# Altium schematic sheet Sheet_BDD.SchDoc (part 1 of 2)
size A3; SheetNumber: 1; SheetTotal: 1
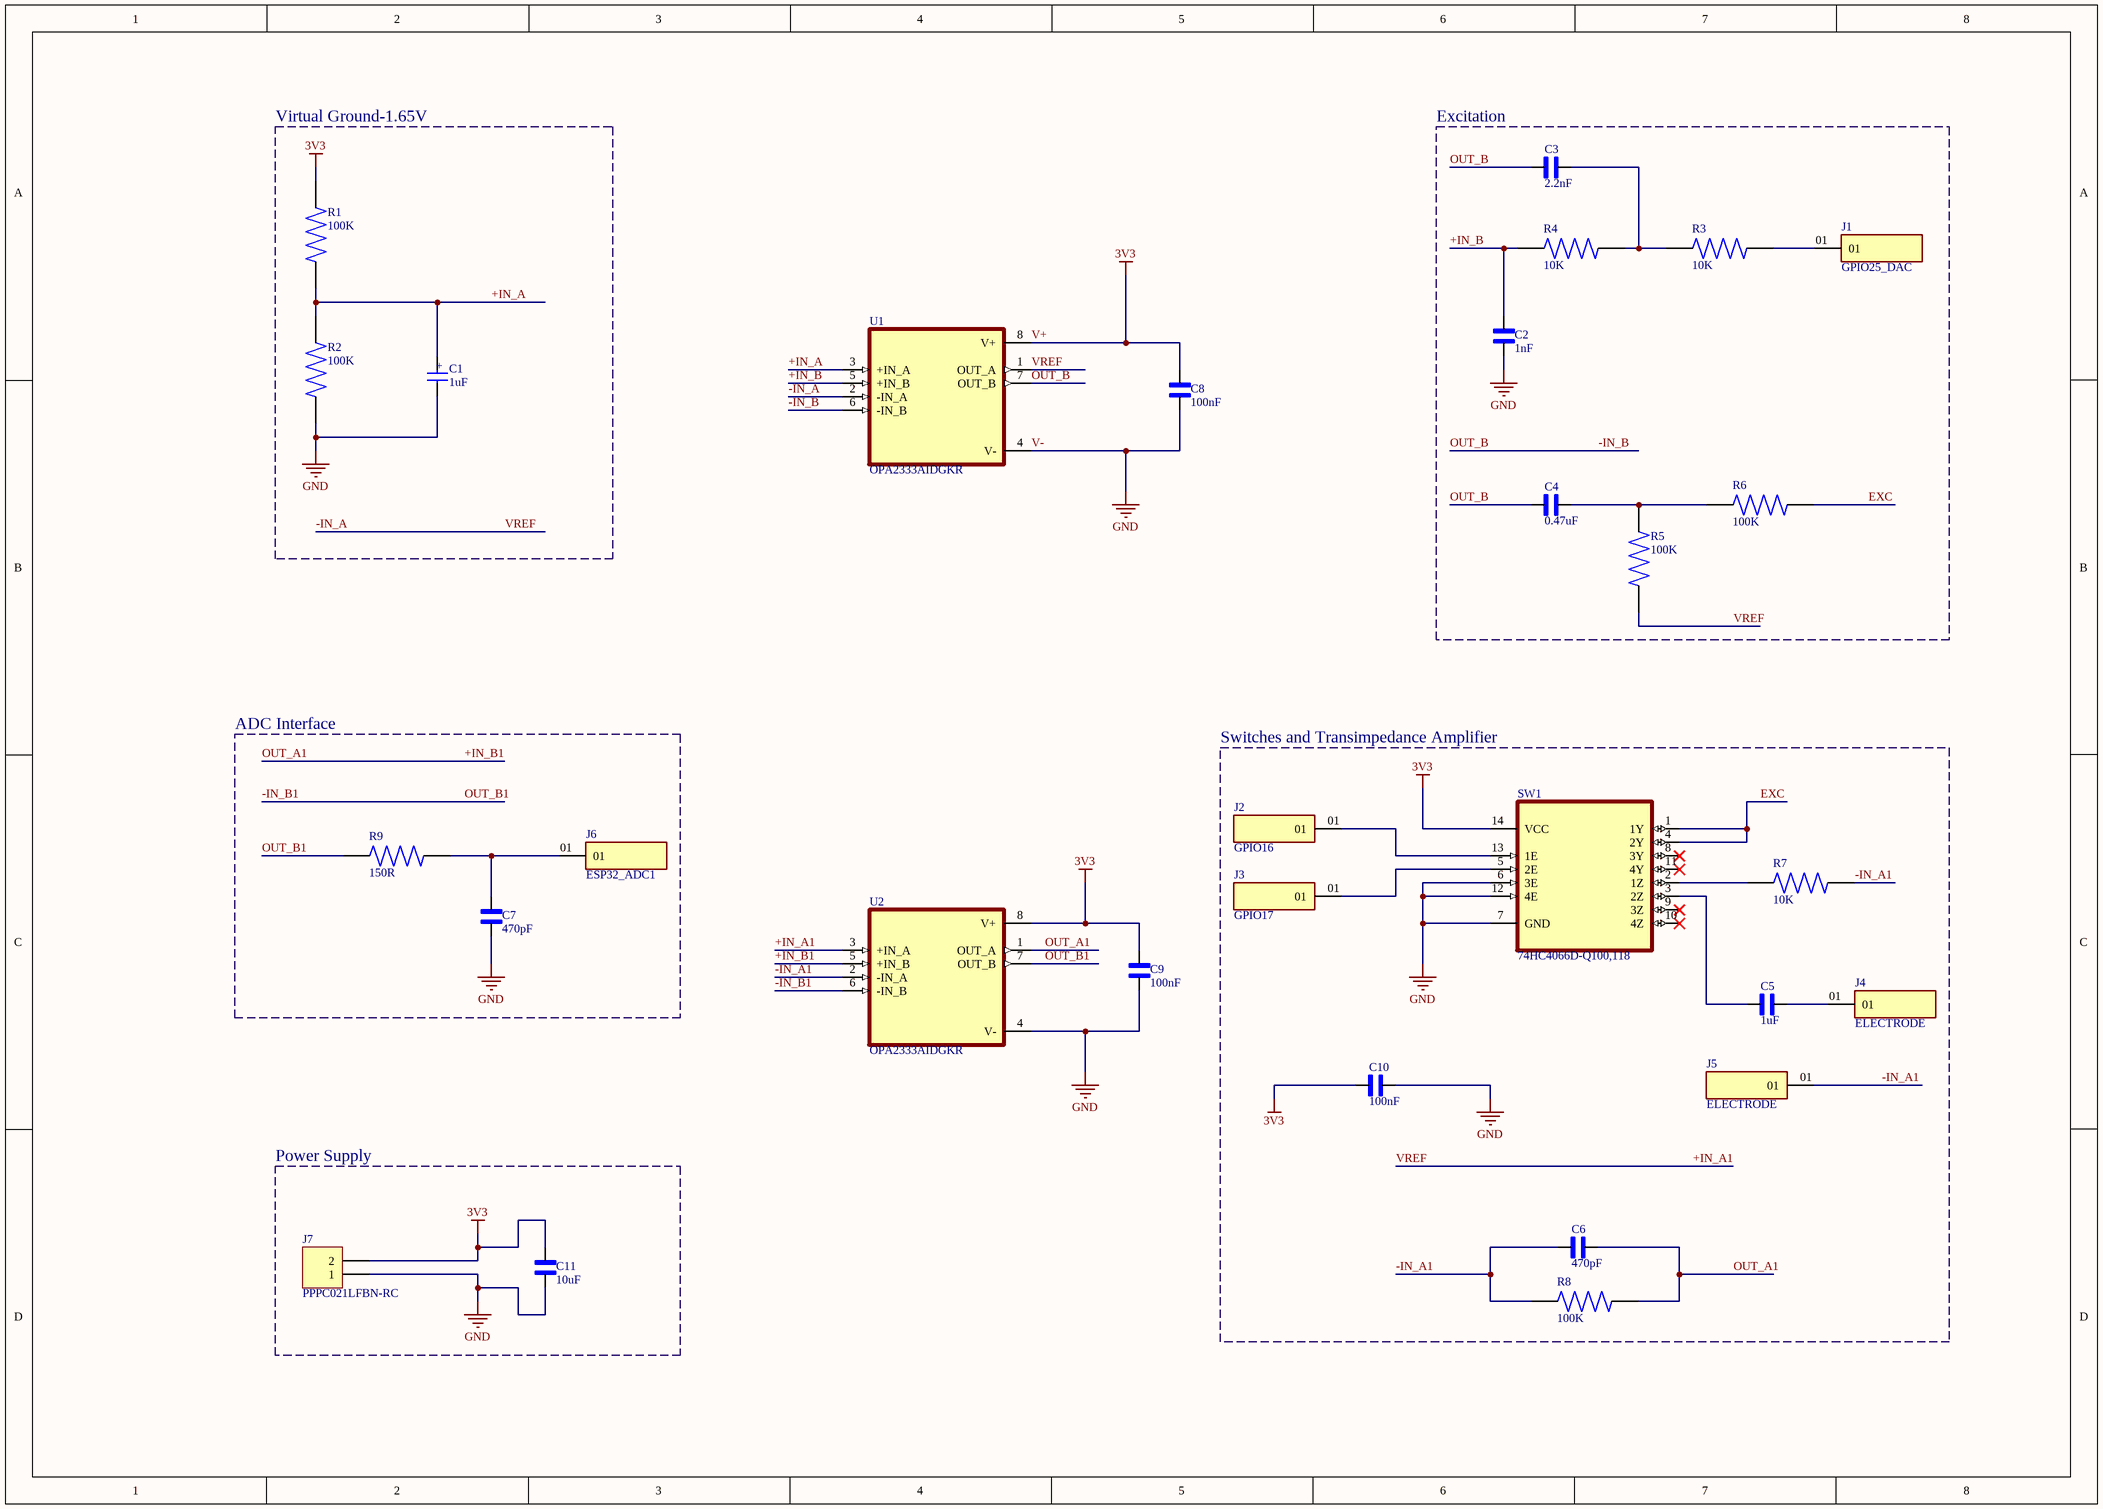
[diagram p0: Sheet_BDD.SchDoc]

## Parts
C1  1uF  [WCAP-ATG5_5X11(DXL)]
C2  1nF  [CAPC2012X140N]
C3  2.2nF  [CAPC2012X88N]
C4  0.47uF  [CAPC2012X140N]
C5  1uF  [CAPC2012X140N]
C6  470pF  [CAPC2012X88N]
C7  470pF  [CAPC2012X88N]
C8  100nF  [CAPC2012X140N]
C9  100nF  [CAPC2012X140N]
C10  100nF  [CAPC2012X140N]
C11  10uF  [CAPC2012X140N]
J1  GPIO25_DAC  [SAMTEC_SLW-101-01-T-S]
J2  GPIO16  [SAMTEC_SLW-101-01-T-S]
J3  GPIO17  [SAMTEC_SLW-101-01-T-S]
J4  ELECTRODE  [SAMTEC_SLW-101-01-T-S]
J5  ELECTRODE  [SAMTEC_SLW-101-01-T-S]
J6  ESP32_ADC1  [SAMTEC_SLW-101-01-T-S]
J7  PPPC021LFBN-RC  [My_1X02]
R1  100K  [RESC2012X65N]
R2  100K  [RESC2012X65N]
R3  10K  [RESC2012X65N]
R4  10K  [RESC2012X65N]
R5  100K  [RESC2012X65N]
R6  100K  [RESC2012X65N]
R7  10K  [RESC2012X65N]
R8  100K  [RESC2012X65N]
R9  150R  [RESC2012X65N]
SW1  74HC4066D-Q100,118  [SOIC127P600X175-14N]
U1  OPA2333AIDGKR  [SOP65P490X110-8N]
U2  OPA2333AIDGKR  [SOP65P490X110-8N]

## Blocks framed on the sheet
Virtual Ground-1.65V: C1 R1 R2
Excitation: C2-C4 J1 R3-R6
ADC Interface: C7 J6 R9
Switches and Transimpedance Amplifier: C5 C6 C10 J2-J5 R7 R8 SW1
Power Supply: C11 J7

## Nets
V+: C8.2 C9.2 C10.1 C11.2 J7.2 R1.2 SW1.14(VCC) U1.8(V+) U2.8(V+)  [also labelled 3V3]
V-: C1.2(NEG) C2.1 C7.1 C8.1 C9.1 C10.2 C11.1 J7.1 R2.1 SW1.6(3E) SW1.7(GND) SW1.12(4E) U1.4(V-) U2.4(V-)  [also labelled GND]
+IN_A: C1.1(POS) R1.1 R2.2 U1.3(+IN_A)
+IN_A1: R5.1 U1.1(OUT_A) U1.2(-IN_A) U2.3(+IN_A)  [also labelled -IN_A, VREF]
+IN_B: C2.2 R4.1 U1.5(+IN_B)
+IN_B1: C6.2 R8.2 U2.1(OUT_A) U2.5(+IN_B)  [also labelled OUT_A1]
-IN_A1: C6.1 J5.01 R7.2 R8.1 U2.2(-IN_A)
-IN_B: C3.1 C4.1 U1.6(-IN_B) U1.7(OUT_B)  [also labelled OUT_B]
-IN_B1: R9.1 U2.6(-IN_B) U2.7(OUT_B)  [also labelled OUT_B1]
EXC: R6.1 SW1.1(1Y) SW1.4(2Y)
NetC3_2: C3.2 R3.1 R4.2
NetC4_2: C4.2 R5.2 R6.2
NetC5_1: C5.1 SW1.3(2Z)
NetC5_2: C5.2 J4.01
NetC7_2: C7.2 J6.01 R9.2
NetJ1_01: J1.01 R3.2
NetJ2_01: J2.01 SW1.13(1E)
NetJ3_01: J3.01 SW1.5(2E)
NetR7_1: R7.1 SW1.2(1Z)

Not connected (* = marked no-connect by the designer): SW1 8(3Y)* 9(3Z)* 10(4Z)* 11(4Y)*
## Library data of the parts
C1 = 860020672005: CAP ALUM 1UF 20% 50V RADIAL TH; Manufacturer: Wurth Elektronik; Manufacturer Lifecycle Status: ACTIVE; Value: 1µF; ESR (Equivalent Series Resistance): 39.553Ω; Hole Diameter: 800µm; Leakage Current: 3µA; Life (Hours): 2000hours; Pitch: 2mm; Polarity: Polar; Ripple Current: 13mA; YEOL: 1 = Estimated lifetime > 10 years; Supplier: DigiKey; Supplier Part Number: 732-8851-3-ND; Manufacturer Part Number: 860020672005; RoHS: Compliant; Category: Aluminum Electrolytic Capacitors; Stock: 70000; Pricing: 2000=0.0551 (USD); Case/Package: Radial; Diameter: 5mm; Height: 11mm; Height - Seated (Max): 12.4968mm; Lead Pitch: 2.0066mm; Length: 11mm; Lifecycle Status: Production; Max Operating Temperature: 105°C; Min Operating Temperature: -40°C; Mounting Technology: Through Hole; Packaging: Tape & Box (TB); REACH SVHC: Unknown; Tolerance: 20%; Voltage Rating: 50V; Voltage Rating (DC): 50V; ComponentLink1URL: https://datasheet.octopart.com:443/860020672005-Wurth-Elektronik-datasheet-159617218.pdf?src-supplier=Wurth+Elektronik; ComponentLink1Description: https://datasheet.octopart.com:443/860020672005-Wurth-Elektronik-datasheet-159617218.pdf?src-supplier=Wurth+Elektronik; ComponentLink2URL: https://datasheet.octopart.com:443/860020672005-W%C3%BCrth-Elektronik-datasheet-37143900.pdf?src-supplier=RS+(Formerly+Allied+Electronics); ComponentLink2Description: https://datasheet.octopart.com:443/860020672005-W%C3%BCrth-Elektronik-datasheet-37143900.pdf?src-supplier=RS+(Formerly+Allied+Electronics)
C2 = C0805C102K5RACTU: CAP CER 1000PF 50V X7R 0805; Manufacturer: Yageo Group; Dielectric Material: Ceramic; Temperature Coefficient: 30ppm/°C; Tolerance: 10%; Supplier: DigiKey; Supplier Part Number: 399-C0805C102K5RACTUCT-ND; Manufacturer Part Number: C0805C102K5RACTU; RoHS: Compliant; Category: Ceramic Capacitors; Stock: 586001; Pricing: 1=0.16, 10=0.088, 50=0.0612, 100=0.0529, 500=0.03924 (USD); Value: 1nF; Case/Package: 0805; Case Code (Imperial): 0805; China RoHS: Compliant; Contact Plating: Tin; Country of Origin: Mexico; Depth: 1.25mm; Dielectric: X7R; Export Control Classification Number (ECCN) Code: EAR99; Height: 780µm; Harmonized Tariff Schedule (HTS) Code: 8532.24.00.20; Introduction Date: 2008-01-10; Lead Free: Lead Free; Lead Pitch: 750µm; Length: 2mm; Lifecycle Status: Production; Material: Ceramic; Max Operating Temperature: 125°C; Min Operating Temperature: -55°C; Mounting Technology: Surface Mount; Pins: 2; Number of Terminals: 2; Packaging: Cut Tape; Radiation Hardening: No; REACH SVHC: Unaffected; Schedule B: 8532240020, 8532240020|8532240020, 8532240020|8532240020|8532240020, 8532240020|8532240020|8532240020|8532240020; Termination: SMD/SMT; Thickness: 889µm; Voltage: 50V; Voltage Rating: 50V; Voltage Rating (DC): 50V; Width: 1.25mm; ComponentLink1URL: https://datasheet.octopart.com:443/C0805C102K5RAC7800-KEMET-datasheet-179100141.pdf?src-supplier=IHS; ComponentLink1Description: https://datasheet.octopart.com:443/C0805C102K5RAC7800-KEMET-datasheet-179100141.pdf?src-supplier=IHS; ComponentLink2URL: https://datasheet.octopart.com:443/C0805C102K5RACTU-KEMET-datasheet-178445679.pdf?src-supplier=IHS; ComponentLink2Description: https://datasheet.octopart.com:443/C0805C102K5RACTU-KEMET-datasheet-178445679.pdf?src-supplier=IHS; ComponentLink3URL: https://datasheet.octopart.com:443/C0805C102K5RACTU-KEMET-datasheet-137357759.pdf?src-supplier=Farnell; ComponentLink3Description: https://datasheet.octopart.com:443/C0805C102K5RACTU-KEMET-datasheet-137357759.pdf?src-supplier=Farnell; ComponentLink4URL: https://datasheet.octopart.com:443/C0805C102K5RACTU-KEMET-datasheet-32036385.pdf?src-supplier=Farnell; ComponentLink4Description: https://datasheet.octopart.com:443/C0805C102K5RACTU-KEMET-datasheet-32036385.pdf?src-supplier=Farnell; ComponentLink5URL: https://datasheet.octopart.com:443/C0805C102K5RACTU-Kemet-datasheet-12608295.pdf?src-supplier=Farnell; ComponentLink5Description: https://datasheet.octopart.com:443/C0805C102K5RACTU-Kemet-datasheet-12608295.pdf?src-supplier=Farnell; ComponentLink6URL: https://datasheet.octopart.com:443/C0805C102K5RACTU-Kemet-datasheet-11992184.pdf?src-supplier=Farnell; ComponentLink6Description: https://datasheet.octopart.com:443/C0805C102K5RACTU-Kemet-datasheet-11992184.pdf?src-supplier=Farnell; ComponentLink7URL: https://datasheet.octopart.com:443/C0805C102K5RACTU-Kemet-datasheet-10942409.pdf?src-supplier=Farnell; ComponentLink7Description: https://datasheet.octopart.com:443/C0805C102K5RACTU-Kemet-datasheet-10942409.pdf?src-supplier=Farnell; ComponentLink8URL: https://datasheet.octopart.com:443/C0805C102K5RACTU-Kemet-datasheet-10404442.pdf?src-supplier=Farnell; ComponentLink8Description: https://datasheet.octopart.com:443/C0805C102K5RACTU-Kemet-datasheet-10404442.pdf?src-supplier=Farnell; ComponentLink9URL: https://datasheet.octopart.com:443/C0805C102K5RACTU-KEMET-datasheet-101576065.pdf?src-supplier=Farnell; ComponentLink9Description: https://datasheet.octopart.com:443/C0805C102K5RACTU-KEMET-datasheet-101576065.pdf?src-supplier=Farnell; ComponentLink10URL: https://datasheet.octopart.com:443/C0805C102K5RACTU.-Kemet-datasheet-41232427.pdf?src-supplier=Farnell; ComponentLink10Description: https://datasheet.octopart.com:443/C0805C102K5RACTU.-Kemet-datasheet-41232427.pdf?src-supplier=Farnell; ComponentLink11URL: https://datasheet.octopart.com:443/C0805C102K5RACTU-KEMET-datasheet-176142286.pdf?src-supplier=Farnell; ComponentLink11Description: https://datasheet.octopart.com:443/C0805C102K5RACTU-KEMET-datasheet-176142286.pdf?src-supplier=Farnell; ComponentLink12URL: https://datasheet.octopart.com:443/C0805C102K5RAC-TU-Kemet-datasheet-7833651.pdf?src-supplier=Farnell; ComponentLink12Description: https://datasheet.octopart.com:443/C0805C102K5RAC-TU-Kemet-datasheet-7833651.pdf?src-supplier=Farnell; ComponentLink13URL: https://datasheet.octopart.com:443/C0805C102K5RAC-TU-Kemet-datasheet-7601896.pdf?src-supplier=Farnell; ComponentLink13Description: https://datasheet.octopart.com:443/C0805C102K5RAC-TU-Kemet-datasheet-7601896.pdf?src-supplier=Farnell; ComponentLink14URL: https://datasheet.octopart.com:443/C0805C102K5RAC-TU-Kemet-datasheet-5316294.pdf?src-supplier=Farnell; ComponentLink14Description: https://datasheet.octopart.com:443/C0805C102K5RAC-TU-Kemet-datasheet-5316294.pdf?src-supplier=Farnell; ComponentLink15URL: https://datasheet.octopart.com:443/C0805C102K5RAC-TU-Kemet-datasheet-5314837.pdf?src-supplier=Farnell; ComponentLink15Description: https://datasheet.octopart.com:443/C0805C102K5RAC-TU-Kemet-datasheet-5314837.pdf?src-supplier=Farnell; ComponentLink16URL: https://datasheet.octopart.com:443/C0805C102K5RAC-TU-Kemet-datasheet-8092359.pdf?src-supplier=Farnell; ComponentLink16Description: https://datasheet.octopart.com:443/C0805C102K5RAC-TU-Kemet-datasheet-8092359.pdf?src-supplier=Farnell; ComponentLink17URL: https://datasheet.octopart.com:443/C0805C102K5RACTU-Kemet-datasheet-5314449.pdf?src-supplier=Farnell; ComponentLink17Description: https://datasheet.octopart.com:443/C0805C102K5RACTU-Kemet-datasheet-5314449.pdf?src-supplier=Farnell; ComponentLink18URL: https://datasheet.octopart.com:443/C0805C102K5RAC-TU-Kemet-datasheet-5314969.pdf?src-supplier=Farnell; ComponentLink18Description: https://datasheet.octopart.com:443/C0805C102K5RAC-TU-Kemet-datasheet-5314969.pdf?src-supplier=Farnell; ComponentLink19URL: https://datasheet.octopart.com:443/C0805C102K5RAC-TU-Kemet-datasheet-5314627.pdf?src-supplier=Farnell; ComponentLink19Description: https://datasheet.octopart.com:443/C0805C102K5RAC-TU-Kemet-datasheet-5314627.pdf?src-supplier=Farnell; ComponentLink20URL: https://datasheet.octopart.com:443/C0805C102K5RAC-TU-Kemet-datasheet-5389132.pdf?src-supplier=Farnell; ComponentLink20Description: https://datasheet.octopart.com:443/C0805C102K5RAC-TU-Kemet-datasheet-5389132.pdf?src-supplier=Farnell; ComponentLink21URL: https://datasheet.octopart.com:443/C0805C102K5RAC-TU-Kemet-datasheet-5313836.pdf?src-supplier=Farnell; ComponentLink21Description: https://datasheet.octopart.com:443/C0805C102K5RAC-TU-Kemet-datasheet-5313836.pdf?src-supplier=Farnell; ComponentLink22URL: https://datasheet.octopart.com:443/C0805C102K5RAC-TU-Kemet-datasheet-8111010.pdf?src-supplier=Farnell; ComponentLink22Description: https://datasheet.octopart.com:443/C0805C102K5RAC-TU-Kemet-datasheet-8111010.pdf?src-supplier=Farnell; ComponentLink23URL: https://datasheet.octopart.com:443/C0805C102K5RAC-TU-Kemet-datasheet-7627733.pdf?src-supplier=Farnell; ComponentLink23Description: https://datasheet.octopart.com:443/C0805C102K5RAC-TU-Kemet-datasheet-7627733.pdf?src-supplier=Farnell; ComponentLink24URL: https://datasheet.octopart.com:443/C0805C102K5RAC-TU-Kemet-datasheet-5315946.pdf?src-supplier=Farnell; ComponentLink24Description: https://datasheet.octopart.com:443/C0805C102K5RAC-TU-Kemet-datasheet-5315946.pdf?src-supplier=Farnell; ComponentLink25URL: https://datasheet.octopart.com:443/C0805C102K5RACTU-KEMET-datasheet-68331921.pdf?src-supplier=Upverter; ComponentLink25Description: https://datasheet.octopart.com:443/C0805C102K5RACTU-KEMET-datasheet-68331921.pdf?src-supplier=Upverter; ComponentLink26URL: https://datasheet.octopart.com:443/C0805C102K5RAC-TU-Kemet-datasheet-5313890.pdf?src-supplier=Newark; ComponentLink26Description: https://datasheet.octopart.com:443/C0805C102K5RAC-TU-Kemet-datasheet-5313890.pdf?src-supplier=Newark; ComponentLink27URL: https://datasheet.octopart.com:443/C0805C102K5RACTU-KEMET-datasheet-130256537.pdf?src-supplier=Newark; ComponentLink27Description: https://datasheet.octopart.com:443/C0805C102K5RACTU-KEMET-datasheet-130256537.pdf?src-supplier=Newark; ComponentLink28URL: https://datasheet.octopart.com:443/C0805C102K5RAC-TU-Kemet-datasheet-5390537.pdf?src-supplier=Newark; ComponentLink28Description: https://datasheet.octopart.com:443/C0805C102K5RAC-TU-Kemet-datasheet-5390537.pdf?src-supplier=Newark; ComponentLink29URL: https://datasheet.octopart.com:443/C0805C102K5RAC-TU-Kemet-datasheet-7541751.pdf?src-supplier=Newark; ComponentLink29Description: https://datasheet.octopart.com:443/C0805C102K5RAC-TU-Kemet-datasheet-7541751.pdf?src-supplier=Newark; ComponentLink30URL: https://datasheet.octopart.com:443/C0805C102K5RACTU-KEMET-datasheet-176289583.pdf?src-supplier=Newark; ComponentLink30Description: https://datasheet.octopart.com:443/C0805C102K5RACTU-KEMET-datasheet-176289583.pdf?src-supplier=Newark; ComponentLink31URL: https://datasheet.octopart.com:443/C0805C102K5RACTU-Kemet-datasheet-8764837.pdf?src-supplier=Newark; ComponentLink31Description: https://datasheet.octopart.com:443/C0805C102K5RACTU-Kemet-datasheet-8764837.pdf?src-supplier=Newark; ComponentLink32URL: https://datasheet.octopart.com:443/C0805C102K5RACTU-Kemet-datasheet-8480123.pdf?src-supplier=Newark; ComponentLink32Description: https://datasheet.octopart.com:443/C0805C102K5RACTU-Kemet-datasheet-8480123.pdf?src-supplier=Newark; ComponentLink33URL: https://datasheet.octopart.com:443/C0805C102K5RACTU-Kemet-datasheet-5393970.pdf?src-supplier=Newark; ComponentLink33Description: https://datasheet.octopart.com:443/C0805C102K5RACTU-Kemet-datasheet-5393970.pdf?src-supplier=Newark; ComponentLink34URL: https://datasheet.octopart.com:443/C0805C102K5RACTU-Kemet-datasheet-8502025.pdf?src-supplier=Newark; ComponentLink34Description: https://datasheet.octopart.com:443/C0805C102K5RACTU-Kemet-datasheet-8502025.pdf?src-supplier=Newark; ComponentLink35URL: https://datasheet.octopart.com:443/C0805C102K5RACTU-Kemet-datasheet-161801.pdf?src-supplier=Newark; ComponentLink35Description: https://datasheet.octopart.com:443/C0805C102K5RACTU-Kemet-datasheet-161801.pdf?src-supplier=Newark; ComponentLink36URL: https://datasheet.octopart.com:443/C0805C102K5RACTU-KEMET-datasheet-184787613.pdf?src-supplier=Newark; ComponentLink36Description: https://datasheet.octopart.com:443/C0805C102K5RACTU-KEMET-datasheet-184787613.pdf?src-supplier=Newark; ComponentLink37URL: https://datasheet.octopart.com:443/C0805C102K5RAC7800-KEMET-datasheet-37550250.pdf?src-supplier=Electro+Sonic; ComponentLink37Description: https://datasheet.octopart.com:443/C0805C102K5RAC7800-KEMET-datasheet-37550250.pdf?src-supplier=Electro+Sonic; ComponentLink38URL: https://datasheet.octopart.com:443/C0805C102K5RAC7800-KEMET-datasheet-188512054.pdf?src-supplier=ODG+(Origin+Data+Global); ComponentLink38Description: https://datasheet.octopart.com:443/C0805C102K5RAC7800-KEMET-datasheet-188512054.pdf?src-supplier=ODG+(Origin+Data+Global); ComponentLink39URL: https://datasheet.octopart.com:443/C0805C102K5RACTU-KEMET-datasheet-164512540.pdf?src-supplier=TME; ComponentLink39Description: https://datasheet.octopart.com:443/C0805C102K5RACTU-KEMET-datasheet-164512540.pdf?src-supplier=TME; ComponentLink40URL: https://datasheet.octopart.com:443/C0805C102K5RACTU-Kemet-datasheet-67847102.pdf?src-supplier=TME; ComponentLink40Description: https://datasheet.octopart.com:443/C0805C102K5RACTU-Kemet-datasheet-67847102.pdf?src-supplier=TME; ComponentLink41URL: https://datasheet.octopart.com:443/C0805C102K5RACTU-KEMET-datasheet-68331906.pdf?src-supplier=TME; ComponentLink41Description: https://datasheet.octopart.com:443/C0805C102K5RACTU-KEMET-datasheet-68331906.pdf?src-supplier=TME; ComponentLink42URL: https://datasheet.octopart.com:443/C0805C102K5RACTU-KEMET-datasheet-110724412.pdf?src-supplier=RS+(Formerly+Allied+Electronics); ComponentLink42Description: https://datasheet.octopart.com:443/C0805C102K5RACTU-KEMET-datasheet-110724412.pdf?src-supplier=RS+(Formerly+Allied+Electronics); ComponentLink43URL: https://datasheet.octopart.com:443/C0805C102K5RACTU-Kemet-datasheet-464.pdf?src-supplier=RS+(Formerly+Allied+Electronics); ComponentLink43Description: https://datasheet.octopart.com:443/C0805C102K5RACTU-Kemet-datasheet-464.pdf?src-supplier=RS+(Formerly+Allied+Electronics); ComponentLink44URL: https://datasheet.octopart.com/C0805C102K5RACTU-KEMET-datasheet-84169754.pdf; ComponentLink44Description: https://datasheet.octopart.com/C0805C102K5RACTU-KEMET-datasheet-84169754.pdf; ComponentLink45URL: https://datasheet.octopart.com:443/C0805C102K5RACTU-Kemet-datasheet-24570007.pdf?src-supplier=element14+APAC; ComponentLink45Description: https://datasheet.octopart.com:443/C0805C102K5RACTU-Kemet-datasheet-24570007.pdf?src-supplier=element14+APAC; ComponentLink46URL: https://datasheet.octopart.com:443/C0805C102K5RACTU-Kemet-datasheet-22084244.pdf?src-supplier=element14+APAC; ComponentLink46Description: https://datasheet.octopart.com:443/C0805C102K5RACTU-Kemet-datasheet-22084244.pdf?src-supplier=element14+APAC; ComponentLink47URL: https://datasheet.octopart.com:443/C0805C102K5RACTU-Kemet-datasheet-11791272.pdf?src-supplier=Arrow+Electronics; ComponentLink47Description: https://datasheet.octopart.com:443/C0805C102K5RACTU-Kemet-datasheet-11791272.pdf?src-supplier=Arrow+Electronics; ComponentLink48URL: https://datasheet.octopart.com:443/C0805C102K5RAC7800-Kemet-datasheet-11546808.pdf?src-supplier=Arrow+Electronics; ComponentLink48Description: https://datasheet.octopart.com:443/C0805C102K5RAC7800-Kemet-datasheet-11546808.pdf?src-supplier=Arrow+Electronics; ComponentLink49URL: https://datasheet.octopart.com:443/C0805C102K5RAC7800-KEMET-datasheet-164857143.pdf?src-supplier=Burklin+Elektronik; ComponentLink49Description: https://datasheet.octopart.com:443/C0805C102K5RAC7800-KEMET-datasheet-164857143.pdf?src-supplier=Burklin+Elektronik; ComponentLink50URL: https://datasheet.octopart.com:443/C0805C102K5RAC-TU-Kemet-datasheet-7272872.pdf?src-supplier=Jameco+(USA); ComponentLink50Description: https://datasheet.octopart.com:443/C0805C102K5RAC-TU-Kemet-datasheet-7272872.pdf?src-supplier=Jameco+(USA); ComponentLink51URL: http://sigma.octopart.com:80/conflict_mineral_statement/Yageo-company-3.pdf?src-supplier=Compliance+Statements; ComponentLink51Description: http://sigma.octopart.com:80/conflict_mineral_statement/Yageo-company-3.pdf?src-supplier=Compliance+Statements; ComponentLink52URL: http://sigma.octopart.com:80/rohs_statement/Yageo-company-2.pdf?src-supplier=Compliance+Statements; ComponentLink52Description: http://sigma.octopart.com:80/rohs_statement/Yageo-company-2.pdf?src-supplier=Compliance+Statements
C3 = C0805C222K5RACTU: CAP CER 2200PF 50V X7R 0805; Manufacturer: Yageo Group; Manufacturer Package Identifier: 0805 (2012 metric); Dielectric Material: Ceramic; Dissipation Factor: 2.5%; Temperature Coefficient: 30ppm/°C; Tolerance: 10%; Supplier: DigiKey; Supplier Part Number: 399-C0805C222K5RACTUCT-ND; Manufacturer Part Number: C0805C222K5RACTU; RoHS: Compliant; Category: Ceramic Capacitors; Stock: 238598; Pricing: 1=0.1, 10=0.055, 50=0.037, 100=0.0318, 500=0.02296 (USD); Value: 2.2nF; Case/Package: 0805; Case Code (Imperial): 0805; China RoHS: Compliant; Country of Origin: Mexico; Depth: 1.25mm; Dielectric: X7R; Export Control Classification Number (ECCN) Code: EAR99; Height: 780µm; Harmonized Tariff Schedule (HTS) Code: 8532.24.00.20; Introduction Date: 2008-01-10; Lead Free: Lead Free; Lead Pitch: 750µm; Length: 2mm; Lifecycle Status: Production; Material: Ceramic; Max Operating Temperature: 125°C; Min Operating Temperature: -55°C; Mounting Technology: Surface Mount; Pins: 2; Number of Terminals: 2; Packaging: Cut Tape; Radiation Hardening: No; REACH SVHC: Unaffected; Schedule B: 8532240020, 8532240020|8532240020, 8532240020|8532240020|8532240020, 8532240020|8532240020|8532240020|8532240020; Termination: SMD/SMT; Thickness: 889µm; Voltage: 50V; Voltage Rating: 50V; Voltage Rating (AC): 50V; Voltage Rating (DC): 50V; Width: 1.25mm; ComponentLink1URL: https://datasheet.octopart.com:443/C0805C222K5RACTU-KEMET-datasheet-178445679.pdf?src-supplier=Farnell; ComponentLink1Description: https://datasheet.octopart.com:443/C0805C222K5RACTU-KEMET-datasheet-178445679.pdf?src-supplier=Farnell; ComponentLink2URL: https://datasheet.octopart.com:443/C0805C222K5RACTU-KEMET-datasheet-137357759.pdf?src-supplier=Farnell; ComponentLink2Description: https://datasheet.octopart.com:443/C0805C222K5RACTU-KEMET-datasheet-137357759.pdf?src-supplier=Farnell; ComponentLink3URL: https://datasheet.octopart.com:443/C0805C222K5RACTU-Kemet-datasheet-5313890.pdf?src-supplier=Farnell; ComponentLink3Description: https://datasheet.octopart.com:443/C0805C222K5RACTU-Kemet-datasheet-5313890.pdf?src-supplier=Farnell; ComponentLink4URL: https://datasheet.octopart.com:443/C0805C222K5RACTU-Kemet-datasheet-8764837.pdf?src-supplier=Farnell; ComponentLink4Description: https://datasheet.octopart.com:443/C0805C222K5RACTU-Kemet-datasheet-8764837.pdf?src-supplier=Farnell; ComponentLink5URL: https://datasheet.octopart.com:443/C0805C222K5RACTU-Kemet-datasheet-8480123.pdf?src-supplier=Farnell; ComponentLink5Description: https://datasheet.octopart.com:443/C0805C222K5RACTU-Kemet-datasheet-8480123.pdf?src-supplier=Farnell; ComponentLink6URL: https://datasheet.octopart.com:443/C0805C222K5RACTU-Kemet-datasheet-5390537.pdf?src-supplier=Farnell; ComponentLink6Description: https://datasheet.octopart.com:443/C0805C222K5RACTU-Kemet-datasheet-5390537.pdf?src-supplier=Farnell; ComponentLink7URL: https://datasheet.octopart.com:443/C0805C222K5RACTU-Kemet-datasheet-5393970.pdf?src-supplier=Farnell; ComponentLink7Description: https://datasheet.octopart.com:443/C0805C222K5RACTU-Kemet-datasheet-5393970.pdf?src-supplier=Farnell; ComponentLink8URL: https://datasheet.octopart.com:443/C0805C222K5RACTU-Kemet-datasheet-8502025.pdf?src-supplier=Farnell; ComponentLink8Description: https://datasheet.octopart.com:443/C0805C222K5RACTU-Kemet-datasheet-8502025.pdf?src-supplier=Farnell; ComponentLink9URL: https://datasheet.octopart.com:443/C0805C222K5RACTU-Kemet-datasheet-7541751.pdf?src-supplier=Farnell; ComponentLink9Description: https://datasheet.octopart.com:443/C0805C222K5RACTU-Kemet-datasheet-7541751.pdf?src-supplier=Farnell; ComponentLink10URL: https://datasheet.octopart.com:443/C0805C222K5RACTU-Kemet-datasheet-161801.pdf?src-supplier=Farnell; ComponentLink10Description: https://datasheet.octopart.com:443/C0805C222K5RACTU-Kemet-datasheet-161801.pdf?src-supplier=Farnell; ComponentLink11URL: https://datasheet.octopart.com:443/C0805C222K5RACTU-KEMET-datasheet-101576227.pdf?src-supplier=Farnell; ComponentLink11Description: https://datasheet.octopart.com:443/C0805C222K5RACTU-KEMET-datasheet-101576227.pdf?src-supplier=Farnell; ComponentLink12URL: https://datasheet.octopart.com:443/C0805C222K5RACTU.-Kemet-datasheet-41232427.pdf?src-supplier=Farnell; ComponentLink12Description: https://datasheet.octopart.com:443/C0805C222K5RACTU.-Kemet-datasheet-41232427.pdf?src-supplier=Farnell; ComponentLink13URL: https://datasheet.octopart.com:443/C0805C222K5RACTU-KEMET-datasheet-176142323.pdf?src-supplier=Farnell; ComponentLink13Description: https://datasheet.octopart.com:443/C0805C222K5RACTU-KEMET-datasheet-176142323.pdf?src-supplier=Farnell; ComponentLink14URL: https://datasheet.octopart.com:443/C0805C222K5RACTU-Kemet-datasheet-12608295.pdf?src-supplier=Farnell; ComponentLink14Description: https://datasheet.octopart.com:443/C0805C222K5RACTU-Kemet-datasheet-12608295.pdf?src-supplier=Farnell; ComponentLink15URL: https://datasheet.octopart.com:443/C0805C222K5RACTU-Kemet-datasheet-11992184.pdf?src-supplier=Farnell; ComponentLink15Description: https://datasheet.octopart.com:443/C0805C222K5RACTU-Kemet-datasheet-11992184.pdf?src-supplier=Farnell; ComponentLink16URL: https://datasheet.octopart.com:443/C0805C222K5RACTU-Kemet-datasheet-10942409.pdf?src-supplier=Farnell; ComponentLink16Description: https://datasheet.octopart.com:443/C0805C222K5RACTU-Kemet-datasheet-10942409.pdf?src-supplier=Farnell; ComponentLink17URL: https://datasheet.octopart.com:443/C0805C222K5RACTU-Kemet-datasheet-10404442.pdf?src-supplier=Farnell; ComponentLink17Description: https://datasheet.octopart.com:443/C0805C222K5RACTU-Kemet-datasheet-10404442.pdf?src-supplier=Farnell; ComponentLink18URL: https://datasheet.octopart.com:443/C0805C222K5RACTU-Kemet-datasheet-500041.pdf?src-supplier=Farnell; ComponentLink18Description: https://datasheet.octopart.com:443/C0805C222K5RACTU-Kemet-datasheet-500041.pdf?src-supplier=Farnell; ComponentLink19URL: https://datasheet.octopart.com:443/C0805C222K5RACTU-KEMET-datasheet-182041860.pdf?src-supplier=IHS; ComponentLink19Description: https://datasheet.octopart.com:443/C0805C222K5RACTU-KEMET-datasheet-182041860.pdf?src-supplier=IHS; ComponentLink20URL: https://datasheet.octopart.com:443/C0805C222K5RACTU-KEMET-datasheet-68331921.pdf?src-supplier=Upverter; ComponentLink20Description: https://datasheet.octopart.com:443/C0805C222K5RACTU-KEMET-datasheet-68331921.pdf?src-supplier=Upverter; ComponentLink21URL: https://datasheet.octopart.com:443/C0805C222K5RACTU-KEMET-datasheet-130256537.pdf?src-supplier=Newark; ComponentLink21Description: https://datasheet.octopart.com:443/C0805C222K5RACTU-KEMET-datasheet-130256537.pdf?src-supplier=Newark; ComponentLink22URL: https://datasheet.octopart.com:443/C0805C222K5RACTU-KEMET-datasheet-170667462.pdf?src-supplier=Newark; ComponentLink22Description: https://datasheet.octopart.com:443/C0805C222K5RACTU-KEMET-datasheet-170667462.pdf?src-supplier=Newark; ComponentLink23URL: https://datasheet.octopart.com:443/C0805C222K5RACTU-Kemet-datasheet-27203261.pdf?src-supplier=Newark; ComponentLink23Description: https://datasheet.octopart.com:443/C0805C222K5RACTU-Kemet-datasheet-27203261.pdf?src-supplier=Newark; ComponentLink24URL: https://datasheet.octopart.com:443/C0805C222K5RACTU-KEMET-datasheet-37550250.pdf?src-supplier=Electro+Sonic; ComponentLink24Description: https://datasheet.octopart.com:443/C0805C222K5RACTU-KEMET-datasheet-37550250.pdf?src-supplier=Electro+Sonic; ComponentLink25URL: https://datasheet.octopart.com:443/C0805C222K5RACTU-KEMET-datasheet-178249621.pdf?src-supplier=Master+Electronics; ComponentLink25Description: https://datasheet.octopart.com:443/C0805C222K5RACTU-KEMET-datasheet-178249621.pdf?src-supplier=Master+Electronics; ComponentLink26URL: https://datasheet.octopart.com:443/C0805C222K5RACTU-KEMET-datasheet-164512540.pdf?src-supplier=TME; ComponentLink26Description: https://datasheet.octopart.com:443/C0805C222K5RACTU-KEMET-datasheet-164512540.pdf?src-supplier=TME; ComponentLink27URL: https://datasheet.octopart.com:443/C0805C222K5RACTU-Kemet-datasheet-67847123.pdf?src-supplier=TME; ComponentLink27Description: https://datasheet.octopart.com:443/C0805C222K5RACTU-Kemet-datasheet-67847123.pdf?src-supplier=TME; ComponentLink28URL: https://datasheet.octopart.com:443/C0805C222K5RACTU-KEMET-datasheet-68331906.pdf?src-supplier=TME; ComponentLink28Description: https://datasheet.octopart.com:443/C0805C222K5RACTU-KEMET-datasheet-68331906.pdf?src-supplier=TME; ComponentLink29URL: https://datasheet.octopart.com:443/C0805C222K5RACTU-KEMET-datasheet-110724412.pdf?src-supplier=RS+(Formerly+Allied+Electronics); ComponentLink29Description: https://datasheet.octopart.com:443/C0805C222K5RACTU-KEMET-datasheet-110724412.pdf?src-supplier=RS+(Formerly+Allied+Electronics); ComponentLink30URL: https://datasheet.octopart.com:443/C0805C222K5RACTU-Kemet-datasheet-464.pdf?src-supplier=RS+(Formerly+Allied+Electronics); ComponentLink30Description: https://datasheet.octopart.com:443/C0805C222K5RACTU-Kemet-datasheet-464.pdf?src-supplier=RS+(Formerly+Allied+Electronics); ComponentLink31URL: https://datasheet.octopart.com/C0805C222K5RACTU-KEMET-datasheet-84169754.pdf; ComponentLink31Description: https://datasheet.octopart.com/C0805C222K5RACTU-KEMET-datasheet-84169754.pdf; ComponentLink32URL: https://datasheet.octopart.com:443/C0805C222K5RACTU-Kemet-datasheet-11791665.pdf?src-supplier=Arrow+Electronics; ComponentLink32Description: https://datasheet.octopart.com:443/C0805C222K5RACTU-Kemet-datasheet-11791665.pdf?src-supplier=Arrow+Electronics; ComponentLink33URL: https://datasheet.octopart.com:443/C0805C222K5RAC7800-KEMET-datasheet-164857143.pdf?src-supplier=Burklin+Elektronik; ComponentLink33Description: https://datasheet.octopart.com:443/C0805C222K5RAC7800-KEMET-datasheet-164857143.pdf?src-supplier=Burklin+Elektronik; ComponentLink34URL: http://sigma.octopart.com:80/conflict_mineral_statement/Yageo-company-3.pdf?src-supplier=Compliance+Statements; ComponentLink34Description: http://sigma.octopart.com:80/conflict_mineral_statement/Yageo-company-3.pdf?src-supplier=Compliance+Statements; ComponentLink35URL: http://sigma.octopart.com:80/rohs_statement/Yageo-company-2.pdf?src-supplier=Compliance+Statements; ComponentLink35Description: http://sigma.octopart.com:80/rohs_statement/Yageo-company-2.pdf?src-supplier=Compliance+Statements
C4 = GRM21BR72A474KA73L: CAP CER 0.47UF 100V X7R 0805; Manufacturer: Murata; Manufacturer Lifecycle Status: IN PRODUCTION; Value: 470nF; Dielectric Material: Ceramic; Tolerance: 10%; Supplier: DigiKey; Supplier Part Number: 490-3326-1-ND; Manufacturer Part Number: GRM21BR72A474KA73L; RoHS: Compliant; Category: Ceramic Capacitors; Stock: 1382; Pricing: 1=0.4, 10=0.241, 50=0.1776, 100=0.1582, 500=0.1253 (USD); Case/Package: 0805; Case Code (Imperial): 0805; Case Code (Metric): 2012; Country of Origin: Japan, Mainland China, Philippines, Singapore, Thailand; Depth: 1.25mm; Dielectric: X7R; Export Control Classification Number (ECCN) Code: EAR99; Height: 1.25mm; Harmonized Tariff Schedule (HTS) Code: 8532.24.00.20; Introduction Date: 2006-11-17; Lead Free: Lead Free; Length: 2mm; Lifecycle Status: Production; Material: Ceramic; Max Operating Temperature: 125°C; Min Operating Temperature: -55°C; Mounting Technology: Surface Mount; Number of Terminals: 2; Packaging: Cut Tape; Radiation Hardening: No; REACH SVHC: Unaffected; Schedule B: 8532240020, 8532240020|8532240020, 8532240020|8532240020|8532240020, 8532240020|8532240020|8532240020|8532240020; Termination: SMD/SMT; Thickness: 1.25mm; Voltage: 100V; Voltage Rating: 100V; Voltage Rating (DC): 100V; Width: 1.25mm; ComponentLink1URL: https://datasheet.octopart.com:443/GRM21BR72A474KA73L-Murata-datasheet-66077118.pdf?src-supplier=element14+APAC; ComponentLink1Description: https://datasheet.octopart.com:443/GRM21BR72A474KA73L-Murata-datasheet-66077118.pdf?src-supplier=element14+APAC; ComponentLink2URL: https://datasheet.octopart.com:443/GRM21BR72A474KA73L-Murata-datasheet-595945.pdf?src-supplier=_legacy+Avnet; ComponentLink2Description: https://datasheet.octopart.com:443/GRM21BR72A474KA73L-Murata-datasheet-595945.pdf?src-supplier=_legacy+Avnet; ComponentLink3URL: https://datasheet.octopart.com:443/GRM21BR72A474KA73L-Murata-datasheet-165579666.pdf?src-supplier=TME; ComponentLink3Description: https://datasheet.octopart.com:443/GRM21BR72A474KA73L-Murata-datasheet-165579666.pdf?src-supplier=TME; ComponentLink4URL: https://datasheet.octopart.com:443/GRM21BR72A474KA73L-Murata-datasheet-59876780.pdf?src-supplier=TME; ComponentLink4Description: https://datasheet.octopart.com:443/GRM21BR72A474KA73L-Murata-datasheet-59876780.pdf?src-supplier=TME; ComponentLink5URL: https://datasheet.octopart.com:443/GRM21BR72A474KA73L-Murata-datasheet-140707811.pdf?src-supplier=Ciiva; ComponentLink5Description: https://datasheet.octopart.com:443/GRM21BR72A474KA73L-Murata-datasheet-140707811.pdf?src-supplier=Ciiva; ComponentLink6URL: https://datasheet.octopart.com:443/GRM21BR72A474KA73L-Murata-datasheet-138745109.pdf?src-supplier=Ciiva; ComponentLink6Description: https://datasheet.octopart.com:443/GRM21BR72A474KA73L-Murata-datasheet-138745109.pdf?src-supplier=Ciiva; ComponentLink7URL: https://datasheet.octopart.com:443/GRM21BR72A474KA73L-Murata-datasheet-22122223.pdf?src-supplier=Future+Electronics; ComponentLink7Description: https://datasheet.octopart.com:443/GRM21BR72A474KA73L-Murata-datasheet-22122223.pdf?src-supplier=Future+Electronics; ComponentLink8URL: https://datasheet.octopart.com:443/GRM21BR72A474KA73L-Murata-datasheet-14397553.pdf?src-supplier=Future+Electronics; ComponentLink8Description: https://datasheet.octopart.com:443/GRM21BR72A474KA73L-Murata-datasheet-14397553.pdf?src-supplier=Future+Electronics; ComponentLink9URL: https://datasheet.octopart.com:443/GRM21BR72A474KA73L-Murata-datasheet-44108957.pdf?src-supplier=Future+Electronics; ComponentLink9Description: https://datasheet.octopart.com:443/GRM21BR72A474KA73L-Murata-datasheet-44108957.pdf?src-supplier=Future+Electronics; ComponentLink10URL: https://datasheet.octopart.com/GRM21BR72A474KA73L-Murata-datasheet-12515295.pdf; ComponentLink10Description: https://datasheet.octopart.com/GRM21BR72A474KA73L-Murata-datasheet-12515295.pdf; ComponentLink11URL: https://datasheet.octopart.com/GRM21BR72A474KA73L-Murata-datasheet-12510076.pdf; ComponentLink11Description: https://datasheet.octopart.com/GRM21BR72A474KA73L-Murata-datasheet-12510076.pdf; ComponentLink12URL: https://datasheet.octopart.com/GRM21BR72A474KA73L-Murata-datasheet-11978611.pdf; ComponentLink12Description: https://datasheet.octopart.com/GRM21BR72A474KA73L-Murata-datasheet-11978611.pdf; ComponentLink13URL: https://datasheet.octopart.com/GRM21BR72A474KA73L-Murata-datasheet-10025737.pdf; ComponentLink13Description: https://datasheet.octopart.com/GRM21BR72A474KA73L-Murata-datasheet-10025737.pdf; ComponentLink14URL: https://datasheet.octopart.com/GRM21BR72A474KA73L-Murata-datasheet-8819587.pdf; ComponentLink14Description: https://datasheet.octopart.com/GRM21BR72A474KA73L-Murata-datasheet-8819587.pdf; ComponentLink15URL: https://datasheet.octopart.com/GRM21BR72A474KA73L-Murata-datasheet-14397549.pdf; ComponentLink15Description: https://datasheet.octopart.com/GRM21BR72A474KA73L-Murata-datasheet-14397549.pdf; ComponentLink16URL: https://datasheet.octopart.com:443/GRM21BR72A474KA73L-Murata-datasheet-12510170.pdf?src-supplier=Factory+Futures; ComponentLink16Description: https://datasheet.octopart.com:443/GRM21BR72A474KA73L-Murata-datasheet-12510170.pdf?src-supplier=Factory+Futures; ComponentLink17URL: https://datasheet.octopart.com:443/GRM21BR72A474KA73L-Murata-datasheet-8517407.pdf?src-supplier=Factory+Futures; ComponentLink17Description: https://datasheet.octopart.com:443/GRM21BR72A474KA73L-Murata-datasheet-8517407.pdf?src-supplier=Factory+Futures; ComponentLink18URL: https://datasheet.octopart.com:443/GRM21BR72A474KA73L-Murata-datasheet-8387045.pdf?src-supplier=Factory+Futures; ComponentLink18Description: https://datasheet.octopart.com:443/GRM21BR72A474KA73L-Murata-datasheet-8387045.pdf?src-supplier=Factory+Futures; ComponentLink19URL: https://datasheet.octopart.com:443/GRM21BR72A474KA73L-Murata-datasheet-8324201.pdf?src-supplier=Factory+Futures; ComponentLink19Description: https://datasheet.octopart.com:443/GRM21BR72A474KA73L-Murata-datasheet-8324201.pdf?src-supplier=Factory+Futures; ComponentLink20URL: https://datasheet.octopart.com:443/GRM21BR72A474KA73L-Murata-datasheet-7628724.pdf?src-supplier=Factory+Futures; ComponentLink20Description: https://datasheet.octopart.com:443/GRM21BR72A474KA73L-Murata-datasheet-7628724.pdf?src-supplier=Factory+Futures; ComponentLink21URL: https://datasheet.octopart.com:443/GRM21BR72A474KA73L-Murata-datasheet-552801.pdf?src-supplier=Factory+Futures; ComponentLink21Description: https://datasheet.octopart.com:443/GRM21BR72A474KA73L-Murata-datasheet-552801.pdf?src-supplier=Factory+Futures; ComponentLink22URL: https://datasheet.octopart.com:443/GRM21BR72A474KA73L-Murata-datasheet-11861205.pdf?src-supplier=Arrow+Electronics; ComponentLink22Description: https://datasheet.octopart.com:443/GRM21BR72A474KA73L-Murata-datasheet-11861205.pdf?src-supplier=Arrow+Electronics; ComponentLink23URL: https://datasheet.octopart.com:443/GRM21BR72A474KA73L-Murata-datasheet-118811.pdf?src-supplier=DigiKey; ComponentLink23Description: https://datasheet.octopart.com:443/GRM21BR72A474KA73L-Murata-datasheet-118811.pdf?src-supplier=DigiKey; ComponentLink24URL: http://sigma.octopart.com:80/reach_statement/Murata-company-16.pdf?src-supplier=Compliance+Statements; ComponentLink24Description: http://sigma.octopart.com:80/reach_statement/Murata-company-16.pdf?src-supplier=Compliance+Statements
C5 C8-C10 = C0805C102K5RACTU: Multilayer Ceramic Capacitors MLCC - SMD/SMT 50V 1000pF X7R 0805 10%; MF: KEMET; SnapEDA_Link: https://www.snapeda.com/parts/C0805C102K5RAC%20TU/Kemet/view-part/?ref=snap; Package: 805-2 KEMET; Value: *; MP: C0805C102K5RAC TU; Check_prices: https://www.snapeda.com/parts/C0805C102K5RAC%20TU/Kemet/view-part/?ref=eda
C6 C7 = C0805C222K5RACTU: Capacitor, Ceramic, Cap, 2200pF, Tol 10%, SMT, 50V, X7R | KEMET C0805C222K5RACTU; SnapEDA_Link: https://www.snapeda.com/parts/C0805C222K5RACTU/KEMET/view-part/?ref=snap; Package: 805-2 KEMET; Value: *; MF: KEMET; MP: C0805C222K5RACTU; Check_prices: https://www.snapeda.com/parts/C0805C222K5RACTU/KEMET/view-part/?ref=eda
C11 = CL21B106KOQNNNE: 16V 10uF X7R 卤10% 0805 Multilayer Ceramic Capacitors MLCC - SMD/SMT ROHS; Manufacturer: Samsung Electro-Mechanics; Value: 10µF; Tolerance: 10%; Supplier: DigiKey; Supplier Part Number: 1276-2872-6-ND; Manufacturer Part Number: CL21B106KOQNNNE; RoHS: Compliant; Category: Ceramic Capacitors; Stock: 5268; Pricing: 1=0.28, 10=0.165, 50=0.1194, 100=0.1053, 500=0.08152 (USD); Case/Package: 0805; Case Code (Imperial): 0805; Case Code (Metric): 2012; China RoHS: Compliant; Contact Plating: Tin; Country of Origin: Mainland China, Philippines, South Korea; Depth: 1.25mm; Dielectric: X7R; Dielectric Material: Ceramic; Export Control Classification Number (ECCN) Code: EAR99; Height: 1.4mm; Harmonized Tariff Schedule (HTS) Code: 8532.24.00.20; Introduction Date: 2010-04-09; Length: 2mm; Lifecycle Status: Production; Material: Ceramic; Max Operating Temperature: 125°C; Min Operating Temperature: -55°C; Mounting Technology: Surface Mount; Number of Terminals: 2; Radiation Hardening: No; REACH SVHC: Unaffected; Schedule B: 8532240020, 8532240020|8532240020, 8532240020|8532240020|8532240020, 8532240020|8532240020|8532240020|8532240020; Thickness: 1.397mm; Voltage: 16V; Voltage Rating: 16V; Voltage Rating (DC): 16V; Width: 1.25mm; ComponentLink1URL: https://datasheet.octopart.com:443/CL21B106KOQNNNE-Samsung-Electro-Mechanics-datasheet-136482503.pdf?src-supplier=IHS; ComponentLink1Description: https://datasheet.octopart.com:443/CL21B106KOQNNNE-Samsung-Electro-Mechanics-datasheet-136482503.pdf?src-supplier=IHS; ComponentLink2URL: https://datasheet.octopart.com:443/CL21B106KOQNNNE-Samsung-Electro-Mechanics-datasheet-116891046.pdf?src-supplier=Future+Electronics; ComponentLink2Description: https://datasheet.octopart.com:443/CL21B106KOQNNNE-Samsung-Electro-Mechanics-datasheet-116891046.pdf?src-supplier=Future+Electronics; ComponentLink3URL: https://datasheet.octopart.com:443/CL21B106KOQNNNE-Samsung-Electro-Mechanics-datasheet-81462191.pdf?src-supplier=Future+Electronics; ComponentLink3Description: https://datasheet.octopart.com:443/CL21B106KOQNNNE-Samsung-Electro-Mechanics-datasheet-81462191.pdf?src-supplier=Future+Electronics; ComponentLink4URL: https://datasheet.octopart.com:443/CL21B106KOQNNNE-Samsung-datasheet-12530662.pdf?src-supplier=Future+Electronics; ComponentLink4Description: https://datasheet.octopart.com:443/CL21B106KOQNNNE-Samsung-datasheet-12530662.pdf?src-supplier=Future+Electronics; ComponentLink5URL: https://datasheet.octopart.com:443/CL21B106KOQNNNE-Samsung-datasheet-26669285.pdf?src-supplier=Future+Electronics; ComponentLink5Description: https://datasheet.octopart.com:443/CL21B106KOQNNNE-Samsung-datasheet-26669285.pdf?src-supplier=Future+Electronics; ComponentLink6URL: https://datasheet.octopart.com:443/CL21B106KOQNNNE-Samsung-Electro-Mechanics-datasheet-149045986.pdf?src-supplier=Future+Electronics; ComponentLink6Description: https://datasheet.octopart.com:443/CL21B106KOQNNNE-Samsung-Electro-Mechanics-datasheet-149045986.pdf?src-supplier=Future+Electronics; ComponentLink7URL: https://datasheet.octopart.com/CL21B106KOQNNNE-Samsung-Electro-Mechanics-datasheet-97040617.pdf; ComponentLink7Description: https://datasheet.octopart.com/CL21B106KOQNNNE-Samsung-Electro-Mechanics-datasheet-97040617.pdf; ComponentLink8URL: https://datasheet.octopart.com/CL21B106KOQNNNE-Samsung-Electro-Mechanics-datasheet-8324245.pdf; ComponentLink8Description: https://datasheet.octopart.com/CL21B106KOQNNNE-Samsung-Electro-Mechanics-datasheet-8324245.pdf; ComponentLink9URL: https://datasheet.octopart.com:443/CL21B106KOQNNNE-Samsung-Electro-Mechanics-datasheet-11806859.pdf?src-supplier=Arrow+Electronics; ComponentLink9Description: https://datasheet.octopart.com:443/CL21B106KOQNNNE-Samsung-Electro-Mechanics-datasheet-11806859.pdf?src-supplier=Arrow+Electronics; ComponentLink10URL: https://datasheet.octopart.com:443/CL21B106KOQNNNE-Samsung-datasheet-8326407.pdf?src-supplier=TME; ComponentLink10Description: https://datasheet.octopart.com:443/CL21B106KOQNNNE-Samsung-datasheet-8326407.pdf?src-supplier=TME
J1 = SLW-101-01-T-S: CONN RCPT 1POS TIN PCB; Manufacturer: Samtec; Manufacturer Lifecycle Status: PRODUCTION; Connector Type: Receptacle; Number of Contacts: 1; Supplier: DigiKey; Supplier Part Number: 612-SLW-101-01-T-S-ND; Manufacturer Part Number: SLW-101-01-T-S; RoHS: Compliant; Category: Board to Board Connectors; Stock: 1465; Pricing: 1=0.16, 10=0.14, 100=0.119, 500=0.1062, 1000=0.10112, 5000=0.09025, 10000=0.08594 (USD); Color: Black; Contact Material: Bronze; Contact Plating: Tin; Gender: Receptacle; Height: 4.57mm; Housing Color: Black; Housing Material: Plastic; Lead Free: Lead Free; Length: 2.54mm; Lifecycle Status: Production; Mounting Technology: Through Hole; Pins: 1; Number of Positions: 1; Number of Rows: 1; Orientation: Straight; Packaging: Bulk; Radiation Hardening: No; REACH SVHC: Unaffected; Schedule B: 8536694040, 8536694040|8536694040|8536694040|8536694040|8536694040; Termination: Solder; Width: 2.54mm; ComponentLink1URL: https://datasheet.octopart.com:443/SLW-101-01-T-S-Samtec-datasheet-97281374.pdf?src-supplier=Samtec; ComponentLink1Description: https://datasheet.octopart.com:443/SLW-101-01-T-S-Samtec-datasheet-97281374.pdf?src-supplier=Samtec; ComponentLink2URL: https://sigma.octopart.com:443/97281375/technical_drawing/Samtec-SLW-101-01-T-S.pdf?src-supplier=JRH+Electronics; ComponentLink2Description: https://sigma.octopart.com:443/97281375/technical_drawing/Samtec-SLW-101-01-T-S.pdf?src-supplier=JRH+Electronics; ComponentLink3URL: https://datasheet.octopart.com:443/SLW-101-01-T-S-Samtec-datasheet-195786494.pdf?src-supplier=Toby+Electronics; ComponentLink3Description: https://datasheet.octopart.com:443/SLW-101-01-T-S-Samtec-datasheet-195786494.pdf?src-supplier=Toby+Electronics; ComponentLink4URL: https://datasheet.octopart.com:443/SLW-101-01-T-S-Samtec-datasheet-136395473.pdf?src-supplier=Toby+Electronics; ComponentLink4Description: https://datasheet.octopart.com:443/SLW-101-01-T-S-Samtec-datasheet-136395473.pdf?src-supplier=Toby+Electronics; ComponentLink5URL: https://datasheet.octopart.com:443/SLW-101-01-T-S-Samtec-datasheet-118235307.pdf?src-supplier=Sager+Electronics; ComponentLink5Description: https://datasheet.octopart.com:443/SLW-101-01-T-S-Samtec-datasheet-118235307.pdf?src-supplier=Sager+Electronics; ComponentLink6URL: https://datasheet.octopart.com:443/SLW-101-01-T-S-Samtec-datasheet-86818374.pdf?src-supplier=Sager+Electronics; ComponentLink6Description: https://datasheet.octopart.com:443/SLW-101-01-T-S-Samtec-datasheet-86818374.pdf?src-supplier=Sager+Electronics; ComponentLink7URL: https://datasheet.octopart.com:443/SLW-101-01-T-S-Samtec-datasheet-41643084.pdf?src-supplier=element14+APAC; ComponentLink7Description: https://datasheet.octopart.com:443/SLW-101-01-T-S-Samtec-datasheet-41643084.pdf?src-supplier=element14+APAC; ComponentLink8URL: https://datasheet.octopart.com:443/SLW-101-01-T-S-Samtec-datasheet-151455179.pdf?src-supplier=Newark; ComponentLink8Description: https://datasheet.octopart.com:443/SLW-101-01-T-S-Samtec-datasheet-151455179.pdf?src-supplier=Newark; ComponentLink9URL: https://datasheet.octopart.com:443/SLW-101-01-T-S-Samtec-datasheet-21214624.pdf?src-supplier=Newark; ComponentLink9Description: https://datasheet.octopart.com:443/SLW-101-01-T-S-Samtec-datasheet-21214624.pdf?src-supplier=Newark; ComponentLink10URL: https://datasheet.octopart.com:443/SLW-101-01-T-S-Samtec-datasheet-140570640.pdf?src-supplier=Arrow.cn; ComponentLink10Description: https://datasheet.octopart.com:443/SLW-101-01-T-S-Samtec-datasheet-140570640.pdf?src-supplier=Arrow.cn; ComponentLink11URL: https://datasheet.octopart.com:443/SLW-101-01-T-S-Samtec-datasheet-13696199.pdf?src-supplier=_legacy+Avnet; ComponentLink11Description: https://datasheet.octopart.com:443/SLW-101-01-T-S-Samtec-datasheet-13696199.pdf?src-supplier=_legacy+Avnet
J2-J6 = SLW-101-01-T-S: Value: *; MP: SLW-101-01-T-S; Package: None; Availability: Unavailable; Price: None
J7 = PPPC021LFBN-RC: Female, 2 C, Straight .100" CC; 3.20mm Tail, No Mounting; PBT, Phos. Bronze, 105 C; Manufacturer: Sullins; Connector Type: Header, Socket; Current Rating: 3A; Dielectric Material: Polyester; Number of Contacts: 2; Pitch: 2.54mm; Voltage Rating: 250V; Supplier: DigiKey; Supplier Part Number: S7035-ND; Manufacturer Part Number: PPPC021LFBN-RC; RoHS: Compliant; Category: Card Edge Connectors; Stock: 38153; Pricing: 1=0.28, 10=0.234, 100=0.1984, 500=0.17706, 1000=0.16859, 5000=0.15048, 10000=0.1433 (USD); Color: Black; Contact Material: Gold, Nickel; Contact Plating: Gold; Export Control Classification Number (ECCN) Code: EAR99; Gender: Female; Height: 8.7mm; Housing Material: Plastic; Harmonized Tariff Schedule (HTS) Code: 8536.69.40.40; Introduction Date: 2008-05-14; Lead Free: Lead Free; Length: 5.58mm; Lifecycle Status: Production; Max Operating Temperature: 105°C; Min Operating Temperature: -40°C; Mounting Technology: Through Hole; Number of Positions: 2; Number of Rows: 1; Orientation: Straight; Packaging: Bulk; REACH SVHC: Unaffected; Terminal Pitch: 2.54mm; Termination: Solder; Width: 2.5mm; ComponentLink1URL: https://datasheet.octopart.com:443/PPPC021LFBN-RC-Sullins-datasheet-138810743.pdf?src-supplier=IHS; ComponentLink1Description: https://datasheet.octopart.com:443/PPPC021LFBN-RC-Sullins-datasheet-138810743.pdf?src-supplier=IHS; ComponentLink2URL: https://datasheet.octopart.com:443/PPPC021LFBN-RC-Sullins-datasheet-83216130.pdf?src-supplier=Upverter; ComponentLink2Description: https://datasheet.octopart.com:443/PPPC021LFBN-RC-Sullins-datasheet-83216130.pdf?src-supplier=Upverter; ComponentLink3URL: https://datasheet.octopart.com:443/PPPC021LFBN-RC-Sullins-datasheet-41308905.pdf?src-supplier=Future+Electronics; ComponentLink3Description: https://datasheet.octopart.com:443/PPPC021LFBN-RC-Sullins-datasheet-41308905.pdf?src-supplier=Future+Electronics; ComponentLink4URL: https://datasheet.octopart.com:443/PPPC021LFBN-RC-Sullins-datasheet-12511165.pdf?src-supplier=Future+Electronics; ComponentLink4Description: https://datasheet.octopart.com:443/PPPC021LFBN-RC-Sullins-datasheet-12511165.pdf?src-supplier=Future+Electronics